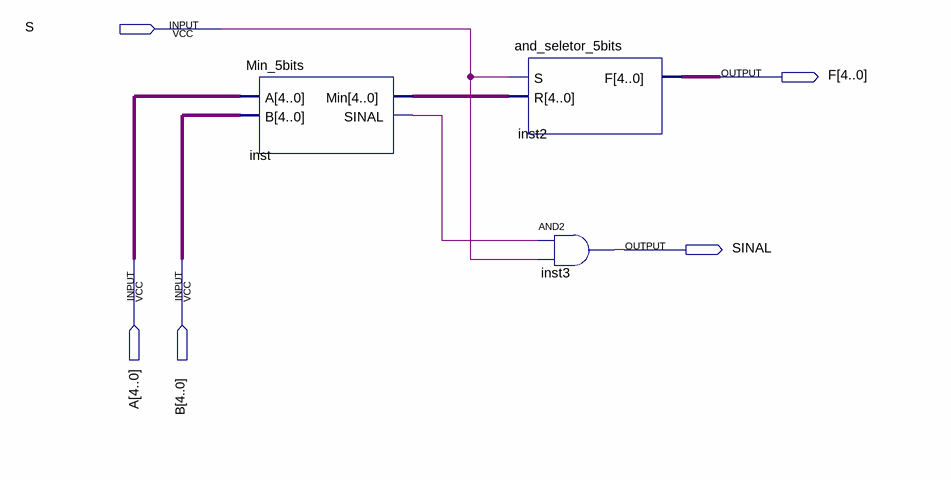
[diagram p0: schematic sheet]
// Quartus schematic BLOCO_min.bdf as structural Verilog: 3 symbols, 5 pins
module BLOCO_min (
  input  S,
  input  [4:0] A,
  input  [4:0] B,
  output [4:0] F,
  output SINAL
);

  wire inst_sinal;
  wire [4:0] inst_min;

  Min_5bits inst (.A(A), .B(B), .Min(inst_min), .SINAL(inst_sinal));
  and_seletor_5bits inst2 (.S(S), .R(inst_min), .F(F));
  and inst3 (SINAL, inst_sinal, S);
endmodule
